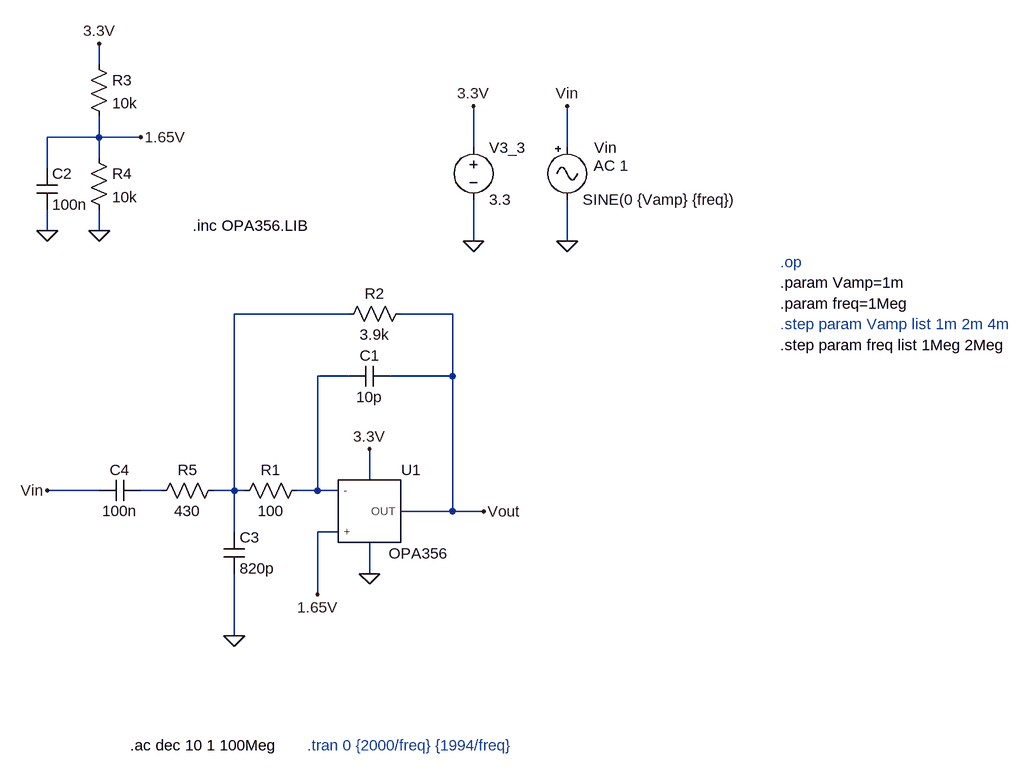
[diagram p0: schematic all.asc]
all.asc, the LTspice schematic file:
Version 4.1
SHEET 1 1444 808
WIRE -208 -256 -208 -288
WIRE -208 -144 -208 -176
WIRE -208 -144 -288 -144
WIRE -144 -144 -208 -144
WIRE 368 -128 368 -192
WIRE 512 -128 512 -192
WIRE -208 -112 -208 -144
WIRE -288 -96 -288 -144
WIRE -288 0 -288 -32
WIRE -208 0 -208 -32
WIRE 368 16 368 -48
WIRE 512 16 512 -48
WIRE 176 128 0 128
WIRE 336 128 256 128
WIRE 176 224 128 224
WIRE 336 224 336 128
WIRE 336 224 240 224
WIRE 208 384 208 336
WIRE -208 400 -288 400
WIRE -112 400 -144 400
WIRE 0 400 0 128
WIRE 0 400 -32 400
WIRE 16 400 0 400
WIRE 128 400 128 224
WIRE 128 400 96 400
WIRE 160 400 128 400
WIRE 336 432 336 224
WIRE 336 432 256 432
WIRE 384 432 336 432
WIRE 0 464 0 400
WIRE 160 464 128 464
WIRE 208 528 208 480
WIRE 128 560 128 464
WIRE 0 624 0 528
FLAG 368 16 0
FLAG 512 16 0
FLAG 368 -192 3.3V
FLAG 512 -192 Vin
FLAG -208 -288 3.3V
FLAG -208 0 0
FLAG -288 0 0
FLAG -144 -144 1.65V
FLAG 208 528 0
FLAG 208 336 3.3V
FLAG 128 560 1.65V
FLAG 384 432 Vout
FLAG -288 400 Vin
FLAG 0 624 0
SYMBOL voltage 368 -144 R0
WINDOW 123 0 0 Left 0
WINDOW 39 0 0 Left 0
SYMATTR InstName V3_3
SYMATTR Value 3.3
SYMBOL Misc\\signal 512 -144 R0
WINDOW 0 42 16 Left 2
WINDOW 123 41 44 Left 2
WINDOW 39 0 0 Left 0
SYMATTR InstName Vin
SYMATTR Value SINE(0 {Vamp} {freq})
SYMATTR Value2 AC 1
SYMBOL res -224 -272 R0
SYMATTR InstName R3
SYMATTR Value 10k
SYMBOL res -224 -128 R0
SYMATTR InstName R4
SYMATTR Value 10k
SYMBOL cap -304 -96 R0
SYMATTR InstName C2
SYMATTR Value 100n
SYMBOL OPA356 208 432 R0
SYMATTR InstName U1
SYMBOL res 272 112 R90
WINDOW 0 0 56 VBottom 2
WINDOW 3 32 56 VTop 2
SYMATTR InstName R2
SYMATTR Value 3.9k
SYMBOL cap 240 208 R90
WINDOW 0 0 32 VBottom 2
WINDOW 3 32 32 VTop 2
SYMATTR InstName C1
SYMATTR Value 10p
SYMBOL res 112 384 R90
WINDOW 0 0 56 VBottom 2
WINDOW 3 32 56 VTop 2
SYMATTR InstName R1
SYMATTR Value 100
SYMBOL cap -16 464 R0
SYMATTR InstName C3
SYMATTR Value 820p
SYMBOL cap -144 384 R90
WINDOW 0 0 32 VBottom 2
WINDOW 3 32 32 VTop 2
SYMATTR InstName C4
SYMATTR Value 100n
SYMBOL res -16 384 R90
WINDOW 0 0 56 VBottom 2
WINDOW 3 32 56 VTop 2
SYMATTR InstName R5
SYMATTR Value 430
TEXT -64 -8 Left 2 !.inc OPA356.LIB
TEXT 840 80 Left 2 !.param Vamp=1m
TEXT 840 112 Left 2 !.param freq=1Meg
TEXT 840 144 Left 2 ;.step param Vamp list 1m 2m 4m
TEXT 840 176 Left 2 !.step param freq list 1Meg 2Meg
TEXT -160 792 Left 2 !.ac dec 10 1 100Meg
TEXT 112 792 Left 2 ;.tran 0 {2000/freq} {1994/freq}
TEXT 840 48 Left 2 ;.op

The netlist it stands for:
* all.asc
V3_3 3.3V 0 3.3
Vin Vin 0 SINE(0 {Vamp} {freq}) AC 1
R3 3.3V 1.65V 10k
R4 1.65V 0 10k
C2 1.65V 0 100n
X§U1 Vout 0 1.65V N002 3.3V OPA356  ; pins OUT -V + - +V
R2 Vout N001 3.9k
C1 Vout N002 10p
R1 N002 N001 100
C3 N001 0 820p
C4 N003 Vin 100n
R5 N001 N003 430
.inc OPA356.LIB
.param Vamp=1m
.param freq=1Meg
* .step param Vamp list 1m 2m 4m
.step param freq list 1Meg 2Meg
.ac dec 10 1 100Meg
* .tran 0 {2000/freq} {1994/freq}
* .op
.lib OPA356.LIB
.backanno
.end